# Altium schematic sheet 000_Hierarchical.SchDoc: Hierarchical system
size A4; Date: xxxxxx; Author: R.Ducuara; DrawnBy: J.Jaramillo; Revision: R1V0; SheetNumber: 1; SheetTotal: 7
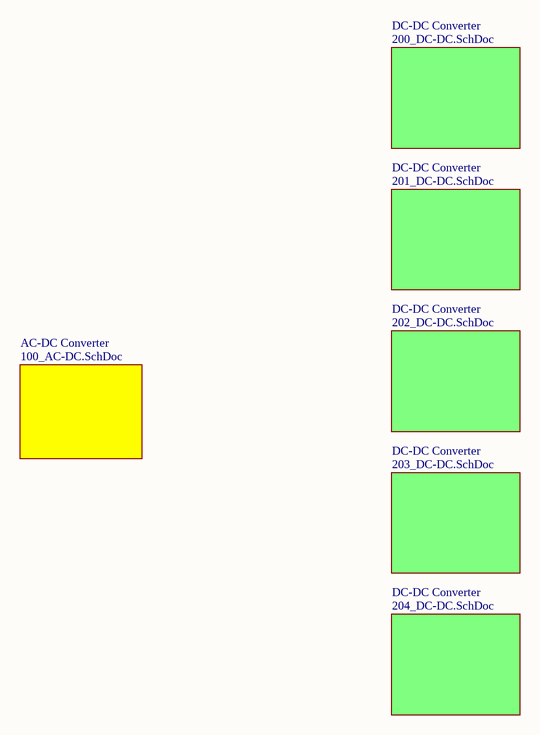
[diagram p0: 000_Hierarchical.SchDoc]

## Sub-sheets
AC-DC Converter = 100_AC-DC.SchDoc: no entries
DC-DC Converter = 200_DC-DC.SchDoc: no entries
DC-DC Converter = 202_DC-DC.SchDoc: no entries
DC-DC Converter = 201_DC-DC.SchDoc: no entries
DC-DC Converter = 203_DC-DC.SchDoc: no entries
DC-DC Converter = 204_DC-DC.SchDoc: no entries

## Notes on the sheet
- Title:
- Project:
- File:
- Revision:
- Date:
- Size:
- A4
- Drawn by: